# Altium project MotorDriver_Board-v1.0.PrjPcb (part 2 of 2)

## Sheet Controller Sheet.SchDoc
size A4; SheetNumber: 4; SheetTotal: 5
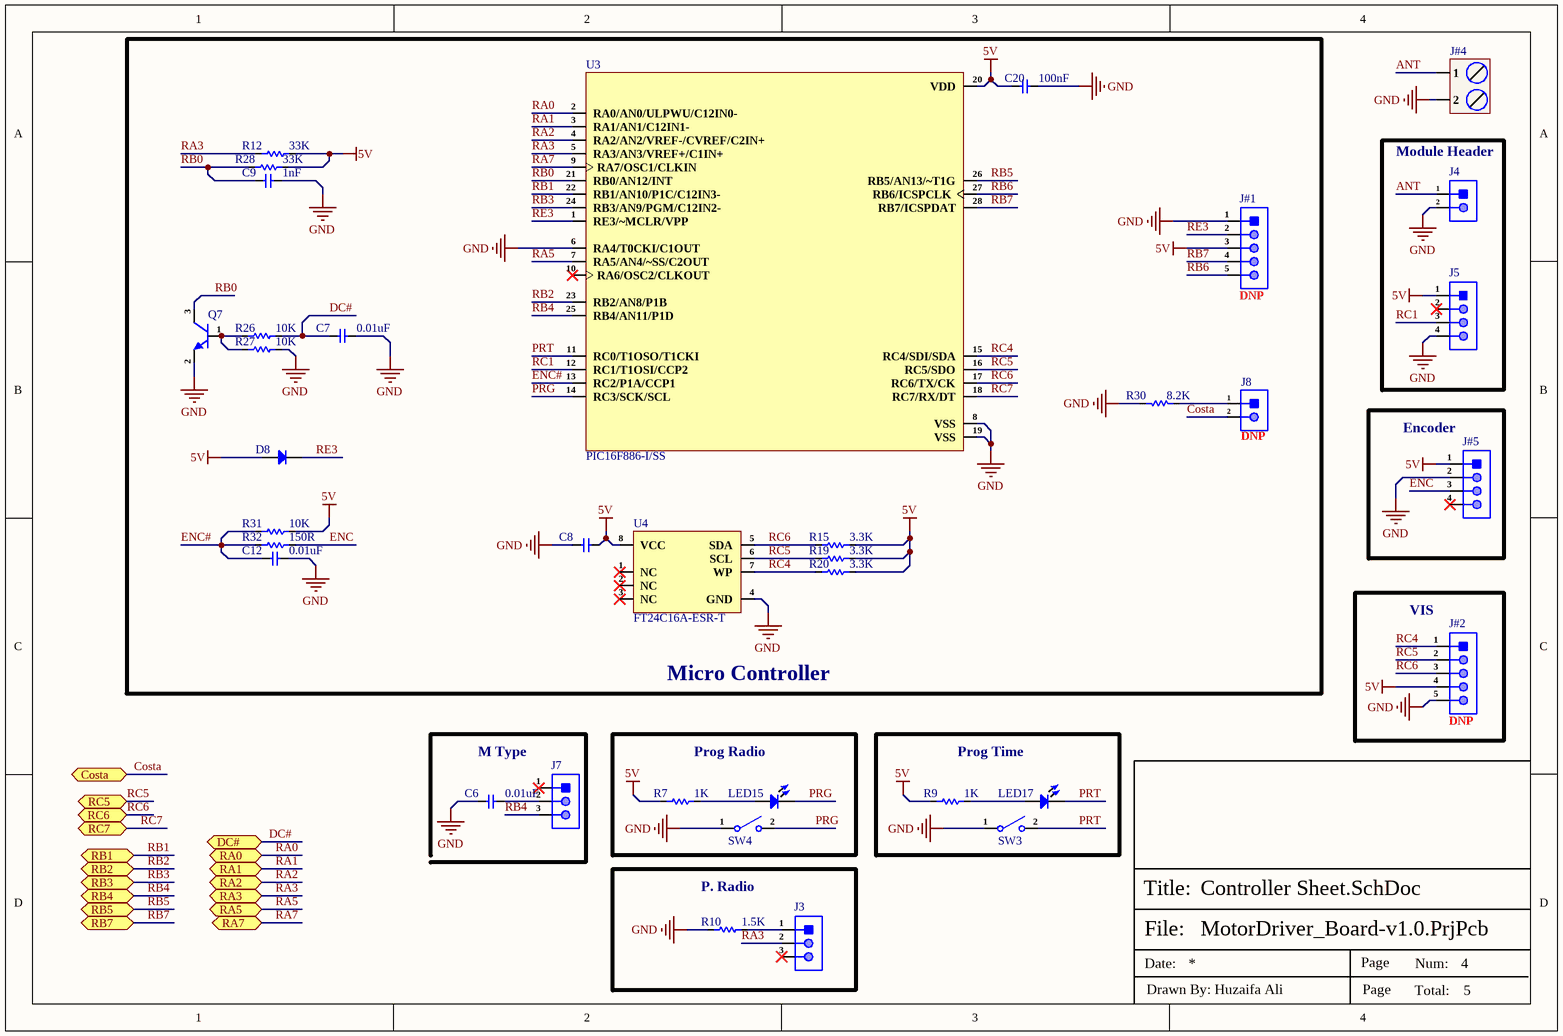
[diagram p2: Controller Sheet.SchDoc]

### Parts
C6  0.01uF  [Cap-0603]
C7  0.01uF  [Cap-0603]
C8  100nF  [Cap-0603]  (value not drawn)
C9  1nF  [Cap-0603]
C12  0.01uF  [Cap-0603]
C20  100nF  [Cap-0603]
D8  1N4148W-7-F  [SOD-123]  (value not drawn)
J3  (no value)  [HDR1X3_]
J4  DM254R-11-02-85  [HDR1X2 (Female)]  (value not drawn)
J5  PPTC041LFBN-RC  [HDR1X4 Female]  (value not drawn)
J7  B-2100S03P-A110  [HDR1X3_]  (value not drawn)
J8  DNP  [HDR1X2 (Female)]
J#1  DNP  [HDR 1x5 Female]
J#2  DNP  [HDR 1x5 Female]
J#4  DB128L-5.08-2P-BK-S  [DB128L-5.08-2P-BK-S]  (value not drawn)
J#5  M2510V-04P  [M2510V-04P]  (value not drawn)
LED15  Blue  [LED-0603]  (value not drawn)
LED17  Blue  [LED-0603]  (value not drawn)
Q7  BC817 6B 160-400  [SOT-23]  (value not drawn)
R7  1K  [Res-0603]
R9  1K  [Res-0603]
R10  1.5K  [Res-0603]
R12  33K  [Res-0603]
R15  3.3K  [Res-0603]
R19  3.3K  [Res-0603]
R20  3.3K  [Res-0603]
R26  10K  [Res-0603]
R27  10K  [Res-0603]
R28  33K  [Res-0603]
R30  8.2K  [Res-0603]
R31  10K  [Res-0603]
R32  150R  [Res-0603]
SW3  TS-1185EC-C-D-B  [TS-1185EC-C-D-B_]  (value not drawn)
SW4  TS-1185EC-C-D-B  [TS-1185EC-C-D-B_]  (value not drawn)
U3  PIC16F886-I/SS  [SSOP-28-208mil]
U4  FT24C16A-ESR-T  [SOP-8]

### Blocks framed on the sheet
Micro Controller: C7-C9 C12 C20 D8 J8 J#1 Q7 R12 R15 R19 R20 R26-R28 R30-R32 U3 U4
Module Header: J4 J5
Encoder: J#5
VIS: J#2
Prog Radio: LED15 R7 SW4
Prog Time: LED17 R9 SW3
P. Radio: J3 R10

### Ports
Costa (bidir, see Top Sheet[3B], Connector Sheet[1D], Peripheral Sheet[1D]), DC# (bidir, see Top Sheet[2B], Power Sheet[1D]), RA0 (bidir, see Top Sheet[3B], Peripheral Sheet[1D]), RA1 (bidir, see Top Sheet[3B], Peripheral Sheet[1D]), RA2 (bidir, see Top Sheet[3B], Peripheral Sheet[1D]), RA3 (bidir, see Top Sheet[3B], Peripheral Sheet[1D]), RA5 (bidir, see Top Sheet[3C], Peripheral Sheet[1D]), RA7 (bidir, see Top Sheet[3C], Peripheral Sheet[1D]), RB1 (bidir, see Top Sheet[2B], Power Sheet[1D]), RB2 (bidir, see Top Sheet[2B], Power Sheet[1D]), RB3 (bidir, see Top Sheet[2B], Power Sheet[1D]), RB4 (bidir, see Top Sheet[2B], Power Sheet[1D]), RB5 (bidir, see Top Sheet[2B], Power Sheet[1D]), RB7 (bidir, see Top Sheet[3C], Peripheral Sheet[1D]), RC5 (bidir, see Top Sheet[3C], Peripheral Sheet[1D]), RC6 (bidir, see Top Sheet[3C], Peripheral Sheet[1D]), RC7 (bidir, see Top Sheet[3C], Peripheral Sheet[1D])

### Nets
5V: C8.1 C20.2 D8.1(A) J5.1 J#1.3 J#2.4 J#5.1 R7.1 R9.1 R12.2 R15.2 R19.2 R20.2 R28.2 R31.1 U3.20(VDD) U4.8(VCC)
GND: C6.1 C7.2 C8.2 C9.2 C12.2 C20.1 J4.2 J5.4 J#1.1 J#2.5 J#4.2 J#5.2 Q7.2(E) R10.1 R27.2 R30.2 SW3.1 SW4.1 U3.6(RA4/T0CKI/C1OUT) U3.8(VSS) U3.19(VSS) U4.4(GND)
ANT: J4.1 J#4.1
Costa: J8.2 ; port Costa
DC#: C7.1 R26.2 ; port DC#
ENC: J#5.3 R32.2
ENC#: C12.1 R31.2 R32.1 U3.13(RC2/P1A/CCP1)
PRG: LED15.2 SW4.2 U3.14(RC3/SCK/SCL)
PRT: LED17.2 SW3.2 U3.11(RC0/T1OSO/T1CKI)
RA0: U3.2(RA0/AN0/ULPWU/C12IN0-) ; port RA0
RA1: U3.3(RA1/AN1/C12IN1-) ; port RA1
RA2: U3.4(RA2/AN2/VREF-/CVREF/C2IN+) ; port RA2
RA3: J3.2 R12.1 U3.5(RA3/AN3/VREF+/C1IN+) ; port RA3
RA5: U3.7(RA5/AN4/~SS/C2OUT) ; port RA5
RA7: U3.9(RA7/OSC1/CLKIN) ; port RA7
RB0: C9.1 Q7.3(C) R28.1 U3.21(RB0/AN12/INT)
RB1: U3.22(RB1/AN10/P1C/C12IN3-) ; port RB1
RB2: U3.23(RB2/AN8/P1B) ; port RB2
RB3: U3.24(RB3/AN9/PGM/C12IN2-) ; port RB3
RB4: J7.3 U3.25(RB4/AN11/P1D) ; port RB4
RB5: U3.26(RB5/AN13/~T1G) ; port RB5
RB6: J#1.5 U3.27(RB6/ICSPCLK)
RB7: J#1.4 U3.28(RB7/ICSPDAT) ; port RB7
RC1: J5.3 U3.12(RC1/T1OSI/CCP2)
RC4: J#2.1 R20.1 U3.15(RC4/SDI/SDA) U4.7(WP)
RC5: J#2.2 R19.1 U3.16(RC5/SDO) U4.6(SCL) ; port RC5
RC6: J#2.3 R15.1 U3.17(RC6/TX/CK) U4.5(SDA) ; port RC6
RC7: U3.18(RC7/RX/DT) ; port RC7
RE3: D8.2(K) J#1.2 U3.1(RE3/~MCLR/VPP)
NetC6_2: C6.2 J7.2
NetJ3_1: J3.1 R10.2
NetJ8_1: J8.1 R30.1
NetLED15_1: LED15.1 R7.2
NetLED17_1: LED17.1 R9.2
NetQ7_1: Q7.1(B) R26.1 R27.1

Not connected (* = marked no-connect by the designer): J3 3*; J5 2*; J7 1*; J#5 4*; U3 10(RA6/OSC2/CLKOUT)*; U4 1(NC)* 2(NC)* 3(NC)*

### Notes on the sheet
- M Type
- File:
- Title:
- Date:
- Page
- Num:
- Total:
- Drawn By: Huzaifa Ali

### Library data of the parts
C6 C7 C12 = GRM1885C1H103JA01D: CAP CER 10000PF 50V C0G/NP0 0603; Manufacturer: Murata; Material: Ceramic; Capacitance: 10nF; Tolerance: 5%; Dielectric: C0G; Supplier 1: RSComponents; Manufacturer Part Number: GRM1885C1H103JA01D; RoHS: Yes; Category: Ceramic Capacitors; Stock 1: 80000; Pricing 1: 4000=0.03500, 8000=0.03200 (GBP); Mount: Surface Mount; Case/Package: 0603; Case Code (Metric): 1608; Case Code (Imperial): 0603; Min Operating Temperature: -55°C; Max Operating Temperature: 125°C; Packaging: Tape and Reel; Package Quantity: 4000; Voltage Rating: 50V; Voltage Rating (DC): 50V; Termination: SMD/SMT; Voltage: 50V; Series: GRM; Length: 1.6mm; Width: 0.8mm; Height: 0.8mm; Thickness: 0.035inch; Lead Pitch: 0.5mm; Depth: 0.8mm; REACH SVHC: No SVHC; Lead Free: Lead Free; RoHS Compliant: Yes; ComponentLink1URL: https://datasheet.ciiva.com/41860/partnumbering-e-01-41860759.pdf?src-supplier=Digi-Key; ComponentLink1Description: https://datasheet.ciiva.com/41860/partnumbering-e-01-41860759.pdf?src-supplier=Digi-Key; ComponentLink2URL: https://datasheet.ciiva.com/29537/partnumbering-e-01-29537910.pdf?src-supplier=Digi-Key; ComponentLink2Description: https://datasheet.ciiva.com/29537/partnumbering-e-01-29537910.pdf?src-supplier=Digi-Key; Supplier Part Number 1: 1449032
C8 C20 = CC0603KRX5R9BB104: CAP CER 0.1UF 50V X5R 0603; Manufacturer: Yageo; Tolerance: 10%; Item Type: Capacitor; Supplier 1: Digi-Key; Manufacturer Part Number: CC0603KRX5R9BB104; RoHS: Yes; Category: Ceramic Capacitors; Stock 1: 152253; Pricing 1: 1=0.10000, 10=0.05200, 50=0.02820, 100=0.02310, 500=0.01648, 1000=0.01294 (USD); Mount: Surface Mount; Case/Package: 0603; Case Code (Imperial): 0603; Case Code (Metric): 1608; Weight: 7.1E-05oz; Min Operating Temperature: -55°C; Max Operating Temperature: 85°C; Capacitance: 100nF; Packaging: Tape and Reel; Voltage Rating: 50V; Dielectric: X5R; Termination: SMD/SMT; Voltage Rating (DC): 50V; Package Quantity: 4000; Length: 0.063inch; Width: 0.031inch; Thickness: 0.035inch; Lead Free: Lead Free; Halogen Free: Halogen Free; ComponentLink1URL: http://www.mouser.com/ds/2/447/Yageo_UPY-GP_NP0_16V-to-50V_9-358835.pdf?src-supplier=Mouser; ComponentLink1Description: http://www.mouser.com/ds/2/447/Yageo_UPY-GP_NP0_16V-to-50V_9-358835.pdf?src-supplier=Mouser; ComponentLink2URL: https://www.yageo.com/upload/media/product/productsearch/datasheet/mlcc/UPY-GPHC_X5R_4V-to-50V_26.pdf?src-supplier=Digi-Key; ComponentLink2Description: https://www.yageo.com/upload/media/product/productsearch/datasheet/mlcc/UPY-GPHC_X5R_4V-to-50V_26.pdf?src-supplier=Digi-Key; ComponentLink3URL: http://www.yageo.com/exep/pages/download/literatures/ProductSelectionGuide%202014_Final_2.pdf?src-supplier=Digi-Key; ComponentLink3Description: http://www.yageo.com/exep/pages/download/literatures/ProductSelectionGuide%202014_Final_2.pdf?src-supplier=Digi-Key; Supplier Part Number 1: 311-4046-1-ND; LCSC Part Number: C110022
C9 = CC0603KRX7R8BB102: CAP CER 0603 1nF 25 V ±10 % Tolerance X7R SMT; Manufacturer: Yageo; Tolerance: 10%; Voltage Rating: 25V; Supplier 1: Arrow Electronics; Manufacturer Part Number: CC0603KRX7R8BB102; RoHS: Yes; Category: Ceramic Capacitors; Stock 1: 974; Pricing 1: 1=0.07500, 10=0.04120, 25=0.04030, 100=0.02020, 250=0.02000, 500=0.01320 (USD); Mount: Surface Mount; Case/Package: 0603; Case Code (Imperial): 0603; Case Code (Metric): 1608; Weight: 7.1E-05oz; Min Operating Temperature: -55°C; Max Operating Temperature: 125°C; Capacitance: 1nF; Dielectric: X7R; Packaging: Tape and Reel; Voltage Rating (DC): 25V; Termination: SMD/SMT; Resistor Type: Ceramic; Series: CC; Construction: Flat; Length: 1.6mm; Width: 0.031inch; Height: 0.8mm; Thickness: 0.035inch; Depth: 0.8mm; Radiation Hardening: No; Lead Free: Lead Free; Halogen Free: Halogen Free; RoHS Compliant: Yes; ComponentLink1URL: https://datasheet.ciiva.com/13263/upy-gphc-x7r-6-3v-to-50v-8-12304-13263372.pdf?src-supplier=Mouser; ComponentLink1Description: https://datasheet.ciiva.com/13263/upy-gphc-x7r-6-3v-to-50v-8-12304-13263372.pdf?src-supplier=Mouser; Supplier Part Number 1: CC0603KRX7R8BB102; LCSC Part Number: C519404
D8 = 1N4148W-7-F: DIODE GEN PURP 100V 300MA SOD123; Manufacturer: Diodes; Forward Current: 150mA; Reverse Recovery Time: 4ns; Max Forward Surge Current (Ifsm): 2A; Element Configuration: Single; Max Reverse Current: 1uA; Forward Voltage: 1.25V; Power Dissipation: 400mW; Polarity: Standard; Voltage Rating (DC): 75V; Value: 2pF; Supplier 1: Future Electronics; Manufacturer Part Number: 1N4148W-7-F; RoHS: Yes; Category: Rectifier Diodes; Stock 1: 32931000; Pricing 1: 3000=0.01840, 12000=0.01760, 45000=0.01690, 120000=0.01640, 300000=0.01560 (USD); Mounting Technology: Surface Mount; Pins: 2; Weight: 0.000353oz; Contact Plating: Tin,Matte; Min Operating Temperature: -65°C; Max Operating Temperature: 150°C; Packaging: Tape and Reel; Max Repetitive Reverse Voltage (Vrrm): 100V; Peak Non-Repetitive Surge Current: 2A; Voltage: 100V; Max Surge Current: 2A; Package Quantity: 3000; Recovery Time: 4ns; Average Rectified Current: 300mA; Power Rating: 400mW; Current Rating: 150mA; Output Current: 150mA; Max Reverse Voltage (DC): 100V; Series: -; Reverse Recovery Time-Max: 4ns; Length: 2.85mm; Width: 1.7mm; Height: 1.25mm; Radiation Hardening: No; RoHS Compliant: Yes; Reach SVHC Compliant: Yes; Lead Free: Lead Free; ComponentLink1URL: https://datasheet.ciiva.com/1179/1915529-1179304.pdf?src-supplier=Element14; ComponentLink1Description: https://datasheet.ciiva.com/1179/1915529-1179304.pdf?src-supplier=Element14; ComponentLink2URL: https://datasheet.ciiva.com/22695/1915529-22695239.pdf?src-supplier=Element14; ComponentLink2Description: https://datasheet.ciiva.com/22695/1915529-22695239.pdf?src-supplier=Element14; ComponentLink3URL: https://datasheet.ciiva.com/8300/ds30086-8300392.pdf?src-supplier=Avnet; ComponentLink3Description: https://datasheet.ciiva.com/8300/ds30086-8300392.pdf?src-supplier=Avnet; ComponentLink4URL: https://datasheet.ciiva.com/15219/getdatasheetpartid-110030-15219548.pdf?src-supplier=Verical; ComponentLink4Description: https://datasheet.ciiva.com/15219/getdatasheetpartid-110030-15219548.pdf?src-supplier=Verical; ComponentLink5URL: https://datasheet.ciiva.com/8303/ds30086-8303197.pdf?src-supplier=Avnet; ComponentLink5Description: https://datasheet.ciiva.com/8303/ds30086-8303197.pdf?src-supplier=Avnet; ComponentLink6URL: https://datasheet.ciiva.com/911/ds30086-911735.pdf?src-supplier=Digi-Key; ComponentLink6Description: https://datasheet.ciiva.com/911/ds30086-911735.pdf?src-supplier=Digi-Key; ComponentLink7URL: https://datasheet.ciiva.com/911/ds30086-911736.pdf?src-supplier=Digi-Key; ComponentLink7Description: https://datasheet.ciiva.com/911/ds30086-911736.pdf?src-supplier=Digi-Key; ComponentLink8URL: https://datasheet.ciiva.com/911/ds30086-911734.pdf?src-supplier=Digi-Key; ComponentLink8Description: https://datasheet.ciiva.com/911/ds30086-911734.pdf?src-supplier=Digi-Key; ComponentLink9URL: https://datasheet.ciiva.com/4435/ds30086-4435128.pdf?src-supplier=Mouser; ComponentLink9Description: https://datasheet.ciiva.com/4435/ds30086-4435128.pdf?src-supplier=Mouser; Supplier Part Number 1: 7634694; LCSC Part Number: C83528; Item Type: Diode
J3 J7 = B-2100S03P-A110: Straight 2.54mm Black Brass 1x3P Plugin,P=2.54mm Pin Headers ROHS; Manufacturer: Ckmtw; Item Type: Header; LCSC Part Number: C124376; Manufacturer Part Number: B-2100S03P-A110; ComponentLink1Description: LCSC; ComponentLink1URL: https://www.lcsc.com/product-detail/Pin-Headers_Ckmtw-Shenzhen-Cankemeng-B-2100S03P-A110_C124376.html
J4 J8 = DM254R-11-02-85: 2.54mm Plugin 3A 2P Straight 1x2P 8.5mm Top Square Holes Plugin,P=2.54mm Female Headers ROHS; Manufacturer: DEALON; Item Type: Header; Manufacturer Part Number: DM254R-11-02-85; Package: Plugin,P=2.54mm; LCSC Part Number: C2935973; ComponentLink1Description: LCSC; ComponentLink1URL: https://www.lcsc.com/product-detail/span-style-background-color-ff0-Female-span-Headers_DEALON-DM254R-11-02-85_C2935973.html
J5 = PPTC041LFBN-RC: CONN HEADER FEMALE 4POS .1 TIN; Manufacturer: Sullins; Number of Positions: 4; Voltage Rating: 250V; Pitch: 2.54mm; Supplier 1: Future Electronics; Manufacturer Part Number: PPTC041LFBN-RC; RoHS: Yes; Category: Connectors; Stock 1: 915; Pricing 1: 1=0.28500, 150=0.27500, 400=0.26500, 1500=0.25500, 4000=0.23500 (USD); Mounting Technology: Through Hole; Contact Material: Bronze; Housing Material: Plastic; Contact Finish - Mating: TIN; Insulation Color: Black; Insulation Material: Polyester; Contact Shape: Square; Min Operating Temperature: -40°C; Max Operating Temperature: 105°C; Number of Rows: 1; Packaging: Tray; Termination: Solder; Connector Type: Header; Contact Type: Female Socket; Fastening Type: Pull; Series: -; Length: 10.7mm; Width: 2.5mm; Height: 8.5mm; Lead Free: Lead Free; RoHS Compliant: Yes; Flammability Rating: UL94 V-0; ComponentLink1URL: https://media.digikey.com/pdf/Data%20Sheets/Sullins%20PDFs/Female_Headers.100_DS.pdf?src-supplier=Digi-Key; ComponentLink1Description: https://media.digikey.com/pdf/Data%20Sheets/Sullins%20PDFs/Female_Headers.100_DS.pdf?src-supplier=Digi-Key; ComponentLink2URL: http://www.sullinscorp.com/catalogs/78_Page80-81_HEADER_.100_2.54mm_FEMALE.pdf?src-supplier=Future+Electronics; ComponentLink2Description: http://www.sullinscorp.com/catalogs/78_Page80-81_HEADER_.100_2.54mm_FEMALE.pdf?src-supplier=Future+Electronics; Supplier Part Number 1: 7137813; LCSC Part Number: C3319639; Item Type: Header
J#1 J#2 = C50950: 2.54mm Plugin Straight 1x5P 5 Plugin,P=2.54mm Female Headers ROHS; Manufacturer: BOOMELE; Manufacturer Part Number: C50950; Package: Plugin,P=2.54mm; LCSC Part Number: C50950; Item Type: Female Header; ComponentLink1Description: LCSC; ComponentLink1URL: https://www.lcsc.com/product-detail/Female-Headers_BOOMELE-Boom-Precision-Elec-C50950_C50950.html
J#4 = DB128L-5.08-2P-BK-S: 1x2P 18A -40℃~+105℃ 250V Black 12~30 Straight pin 5.08mm 2.5 1 2 Plugin,P=5.08mm Screw terminal ROHS; Manufacturer: DIBO; Item Type: Terminal Block; Manufacturer Part Number: DB128L-5.08-2P-BK-S; Package: Plugin,P=5.08mm; LCSC Part Number: C430601; ComponentLink1Description: LCSC; ComponentLink1URL: https://www.lcsc.com/product-detail/Screw-terminal_span-style-background-color-ff0-DIBO-span-DB128L-5-08-2P-BK-S_C430601.html
J#5 = M2510V-04P: 1x4P 1 2.54mm Male pin 4 -25℃~+85℃ 3A Straight Plugin,P=2.54mm Wire To Board / Wire To Wire Connector ROHS; Manufacturer: XFCN; Item Type: Wire To Board Connector; Manufacturer Part Number: M2510V-04P; Package: Plugin,P=2.54mm; LCSC Part Number: C2764792; ComponentLink1Description: LCSC; ComponentLink1URL: https://www.lcsc.com/product-detail/Wire-To-Board-Wire-To-Wire-Connector_XFCN-M2510V-04P_C2764792.html
LED15 LED17 = NCD0603B3: blue 0603 Light Emitting Diodes (LED) ROHS; Manufacturer: Foshan NationStar Optoelectronics; Manufacturer Part Number: NCD0603B3; Package: 0603; LCSC Part Number: C158101; Item Type: LED; ComponentLink1Description: LCSC; ComponentLink1URL: https://www.lcsc.com/product-detail/Light-Emitting-Diodes-LED_Foshan-NationStar-Optoelectronics-NCD0603B3_C158101.html
Q7 = BC817 6B 160-400: 45V 300mW 100@100mA,1V 500mA NPN SOT-23 Bipolar Transistors - BJT ROHS; Manufacturer: DOWO; Manufacturer Part Number: BC817 6B 160-400; Package: SOT-23; LCSC Part Number: C371086; Item Type: Transistor; ComponentLink1Description: LCSC; ComponentLink1URL: https://www.lcsc.com/product-detail/Bipolar-Transistors-BJT_DOWO-BC817-6B-160-400_C371086.html
R7 R9 = RT0603DRD071KL: RES SMD 1K OHM 0.5% 1/10W 0603; Manufacturer: Yageo; Resistance: 1kR; Temperature Coefficient: 25ppm/°C; Power Rating: 100mW; Voltage Rating: 75V; Voltage Rating (DC): 50V; Supplier 1: Digi-Key; Manufacturer Part Number: RT0603DRD071KL; Stock 1: 178947; Pricing 1: 1=0.2, 10=0.167, 100=0.0651, 1000=0.02725, 2500=0.02498 (USD); Case/Package: 0603; Contact Plating: Tin,Matte; Case Code (Metric): 1608; Case Code (Imperial): 0603; Min Operating Temperature: -55°C; Max Operating Temperature: 125°C; Tolerance: 0.5%; Composition: Thin Film; Packaging: Tape and Reel; Termination: SMD/SMT; Radiation Hardening: No; Lead Free: Lead Free; ComponentLink1URL: http://www.mouser.com/ds/2/447/yageodocoutput-1125656.pdf?src-supplier=Mouser; ComponentLink1Description: http://www.mouser.com/ds/2/447/yageodocoutput-1125656.pdf?src-supplier=Mouser; ComponentLink2URL: http://www.yageo.com/documents/recent/PYu-RT_1-to-0.05_RoHS_L_6.pdf?src-supplier=Avnet; ComponentLink2Description: http://www.yageo.com/documents/recent/PYu-RT_1-to-0.05_RoHS_L_6.pdf?src-supplier=Avnet; Supplier Part Number 1: 311-1.0KDDKR-ND; LCSC Part Number: C165964
R10 = RC0603FR-071K5L: RES 1.5K OHM 1% 1/10W 0603; Manufacturer: Yageo; Voltage Rating (DC): 50V; Resistance: 1.5kR; Temperature Coefficient: 100ppm/°C; Power Rating: 100mW; Item Type: Resistor; Supplier 1: Arrow Electronics; Manufacturer Part Number: RC0603FR-071K5L; RoHS: Yes; Category: Chip SMD Resistors; Stock 1: 15000; Pricing 1: 1=0.00160, 5000=0.00160 (USD); Case/Package: 0603; Number of Pins: 2; Case Code (Metric): 1608; Case Code (Imperial): 0603; Size Code: 0603; Min Operating Temperature: -55°C; Max Operating Temperature: 155°C; Tolerance: 1%; Packaging: Tape and Reel; Resistor Type: Thick Film; Voltage Rating: 50V; Package Quantity: 1; Number of Terminations: 2; Termination: SMD/SMT; Max Power Dissipation: 100mW; Features: Moisture Resistant; Series: RC; Resistance Tolerance: 1%; Construction: Rectangular; Length: 0.063inch; Width: 0.031inch; Height: 0.022inch; Depth: 0.8mm; REACH SVHC: No SVHC; Lead Free: Lead Free; Military Standard: Not; RoHS Compliant: Yes; Supplier Part Number 1: RC0603FR-071K5L; LCSC Part Number: C114668
R12 R28 = RT0603BRD0733KL: RES SMD 33K OHM 0.1% 1/10W 0603; Manufacturer: Yageo; Resistance: 33kR; Power Rating: 100mW; Voltage Rating: 75V; Temperature Coefficient: 25ppm/°C; Voltage Rating (DC): 50V; Supplier 1: Arrow Electronics; Manufacturer Part Number: RT0603BRD0733KL; RoHS: Yes; Category: Chip SMD Resistors; Stock 1: 2; Pricing 1: 1=0.30860 (USD); Case/Package: 0603; Case Code (Metric): 1608; Case Code (Imperial): 0603; Weight: 7.1E-05oz; Contact Plating: Tin,Matte; Size Code: 0603; Min Operating Temperature: -55°C; Max Operating Temperature: 125°C; Package Quantity: 5000; Packaging: Tape and Reel; Resistor Type: Thin Film; Number of Terminations: 2; Termination: SMD/SMT; Max Power Dissipation: 100mW; Features: Moisture Resistant; Series: RT; Construction: Rectangular; Length: 1.6mm; Width: 0.031inch; Height: 0.022inch; Depth: 0.8mm; Radiation Hardening: No; Military Standard: Not; Lead Free: Lead Free; RoHS Compliant: Yes; ComponentLink1URL: https://datasheet.ciiva.com/2585/pyu-rt-1-to-0-05-rohs-l-4-2585891.pdf?src-supplier=Digi-Key; ComponentLink1Description: https://datasheet.ciiva.com/2585/pyu-rt-1-to-0-05-rohs-l-4-2585891.pdf?src-supplier=Digi-Key; ComponentLink2URL: https://datasheet.ciiva.com/12810/pyu-rt-1-to-0-05-rohs-l-4-12810117.pdf?src-supplier=Mouser; ComponentLink2Description: https://datasheet.ciiva.com/12810/pyu-rt-1-to-0-05-rohs-l-4-12810117.pdf?src-supplier=Mouser; ComponentLink3URL: https://datasheet.ciiva.com/8889/pyu-rt-1-to-0-05-rohs-l-4-8889590.pdf?src-supplier=Avnet; ComponentLink3Description: https://datasheet.ciiva.com/8889/pyu-rt-1-to-0-05-rohs-l-4-8889590.pdf?src-supplier=Avnet; Supplier Part Number 1: RT0603BRD0733KL; LCSC Part Number: C705768
R15 R19 R20 = RC0603FR-073K3L: RES SMD 3.3K OHM 1% 1/10W 0603; Manufacturer: Yageo Phycomp; Temperature Coefficient: 100ppm/°C; Resistance: 3.3kR; Voltage Rating (DC): 50V; Power Rating: 100mW; Item Type: Resistor; Supplier 1: Digi-Key; Manufacturer Part Number: RC0603FR-073K3L; Stock 1: 6863000; Pricing 1: 1=0.1, 10=0.024, 100=0.0097, 1000=0.00437, 2500=0.00379 (USD); Mount: Surface Mount; Case/Package: 0603; Number of Pins: 2; Min Operating Temperature: -55°C; Max Operating Temperature: 155°C; Tolerance: 1%; Packaging: Cut Tape; Length: 1.6mm; Height: 0.45mm; Width: 800um; Depth: 0.8mm; REACH SVHC: No SVHC; Lead Free: Lead Free; Supplier Part Number 1: 311-3.30KHRCT-ND; LCSC Part Number: C108078
R26 R27 R31 = RC0603FR-0710KL: RES SMD 10K Ohm 1% 1/10W 0603; Manufacturer: Yageo; Resistance: 10kR; Temperature Coefficient: 100ppm/°C; Voltage Rating (DC): 50V; Power Rating: 100mW; Voltage Rating: 75V; Item Type: Resistor; Supplier 1: Digi-Key; Manufacturer Part Number: RC0603FR-0710KL; RoHS: Yes; Category: Chip SMD Resistors; Stock 1: 25249139; Pricing 1: 1=0.10000, 10=0.02400, 100=0.00970, 1000=0.00436, 2500=0.00378 (USD); Case/Package: 0603; Number of Pins: 2; Case Code (Imperial): 0603; Case Code (Metric): 1608; Weight: 7.1E-05oz; Size Code: 0603; Min Operating Temperature: -55°C; Max Operating Temperature: 155°C; Tolerance: 1%; Resistor Type: Thick Film; Packaging: Tape and Reel; Termination: SMD/SMT; Features: Moisture Resistant; Series: RC; Max Power Dissipation: 100mW; Number of Terminations: 2; Resistance Tolerance: 1%; Construction: Rectangular; Length: 1.6mm; Width: 0.8mm; Height: 0.45mm; Depth: 0.8mm; Lead Pitch: 0.3mm; REACH SVHC: Unknown; Lead Free: Lead Free; Military Standard: Not; RoHS Compliant: Yes; ComponentLink1URL: https://datasheet.ciiva.com/7660/38590-7660789.pdf?src-supplier=Element14; ComponentLink1Description: https://datasheet.ciiva.com/7660/38590-7660789.pdf?src-supplier=Element14; ComponentLink2URL: https://datasheet.ciiva.com/7983/443971-7983596.pdf?src-supplier=Element14; ComponentLink2Description: https://datasheet.ciiva.com/7983/443971-7983596.pdf?src-supplier=Element14; ComponentLink3URL: https://datasheet.ciiva.com/22747/443971-22747519.pdf?src-supplier=Element14; ComponentLink3Description: https://datasheet.ciiva.com/22747/443971-22747519.pdf?src-supplier=Element14; ComponentLink4URL: https://datasheet.ciiva.com/46440/1868787-46440891.pdf?src-supplier=Element14; ComponentLink4Description: https://datasheet.ciiva.com/46440/1868787-46440891.pdf?src-supplier=Element14; ComponentLink5URL: https://datasheet.ciiva.com/7746/1738695-7746239.pdf?src-supplier=Element14; ComponentLink5Description: https://datasheet.ciiva.com/7746/1738695-7746239.pdf?src-supplier=Element14; ComponentLink6URL: https://datasheet.ciiva.com/15189/getdatasheetpartid-409289-15189591.pdf?src-supplier=Verical; ComponentLink6Description: https://datasheet.ciiva.com/15189/getdatasheetpartid-409289-15189591.pdf?src-supplier=Verical; Supplier Part Number 1: 311-10.0KHRCT-ND; LCSC Part Number: C98220
R30 = RT0603BRD078K2L: RES SMD 8.2K OHM 0.1% 1/10W 0603; Manufacturer: Yageo; Power: 100mW; Rated Temperature: 70°C; Value: 8.2kR; Temperature Coefficient: 25ppm/°C; Working Voltage: 75V; Package Height: 0.45mm; Package Length: 1.6mm; Package Width: 0.8mm; Item Type: Resistor; Supplier 1: Rs; Manufacturer Part Number: RT0603BRD078K2L; RoHS: Yes; Category: Chip SMD Resistors; Stock 1: 4900; Pricing 1: 100=0.21900, 250=0.20400, 500=0.19000, 1000=0.17400 (GBP); Mounting Technology: Surface Mount; Pins: 2; Case/Package: 0603; Min Operating Temperature: -55°C; Max Operating Temperature: 155°C; Tolerance: 0.1%; Resistor Type: FIXED RESISTOR; Construction: Chip; Package Style: SMTMeter; Packaging: Tape and Reel; Technology: THIN FILM; Termination: Wraparound; Reach SVHC Compliant: Yes; RoHS Compliant: Yes; ComponentLink1URL: https://datasheet.ciiva.com:443/pdfs/VipMasterIC/IC/YAGO/YAGO-S-A0008510989/YAGO-S-A0008510989-1.pdf?src-supplier=IHS+Markit; ComponentLink1Description: https://datasheet.ciiva.com:443/pdfs/VipMasterIC/IC/YAGO/YAGO-S-A0008510989/YAGO-S-A0008510989-1.pdf?src-supplier=IHS+Markit; ComponentLink2URL: https://datasheet.ciiva.com/12809/pyu-rt-1-to-0-05-rohs-l-4-12809820.pdf?src-supplier=Mouser; ComponentLink2Description: https://datasheet.ciiva.com/12809/pyu-rt-1-to-0-05-rohs-l-4-12809820.pdf?src-supplier=Mouser; Supplier Part Number 1: 1991627P; LCSC Part Number: C861589
R32 = RC0603FR-07150RL: RES SMD 150OHM 1/10W 0603; Manufacturer: Yageo; Tolerance: 1%; Power Rating: 100mW; Voltage Rating (DC): 50V; Temperature Coefficient: 100ppm/°C; Supplier 1: Digi-Key; Manufacturer Part Number: RC0603FR-07150RL; RoHS: Yes; Category: Chip SMD Resistors; Stock 1: 263721; Pricing 1: 1=0.10000, 10=0.02400, 100=0.00970, 1000=0.00436, 2500=0.00378 (USD); Case/Package: 0603; Number of Pins: 2; Case Code (Imperial): 0603; Case Code (Metric): 1608; Size Code: 0603; Min Operating Temperature: -55°C; Max Operating Temperature: 155°C; Resistance: 150R; Packaging: Tape and Reel; Voltage Rating: 50V; Package Quantity: 5000; Termination: SMD/SMT; Resistor Type: Thick Film; Features: Moisture Resistant; Series: RC; Max Power Dissipation: 100mW; Number of Terminations: 2; Resistance Tolerance: 1%; Construction: Rectangular; Length: 1.6mm; Width: 0.8mm; Height: 0.45mm; Depth: 0.8mm; REACH SVHC: No SVHC; Lead Free: Lead Free; Military Standard: Not; RoHS Compliant: Yes; ComponentLink1URL: https://datasheet.ciiva.com/46412/443971-46412844.pdf?src-supplier=Element14; ComponentLink1Description: https://datasheet.ciiva.com/46412/443971-46412844.pdf?src-supplier=Element14; ComponentLink2URL: https://datasheet.ciiva.com/46440/1868787-46440893.pdf?src-supplier=Element14; ComponentLink2Description: https://datasheet.ciiva.com/46440/1868787-46440893.pdf?src-supplier=Element14; ComponentLink3URL: https://datasheet.ciiva.com/12555/rc0603-272842-12555301.pdf?src-supplier=Mouser; ComponentLink3Description: https://datasheet.ciiva.com/12555/rc0603-272842-12555301.pdf?src-supplier=Mouser; Supplier Part Number 1: 311-150HRCT-ND; LCSC Part Number: C114608
SW3 SW4 = TS-1185EC-C-D-B: 3mm 2mm Round Button 50mA Top3.65mm SPST 12V SMD Tactile Switches; Manufacturer: XKB; Manufacturer Part Number: TS-1185EC-C-D-B; Footprint: Custom; ComponentLink1Description: LCSC; ComponentLink1URL: https://lcsc.com/product-detail/Tactile-Switches_XKB-Connectivity-TS-1185EC-C-D-B_C318893.html; LCSC Part Number: C318893
U3 = PIC16F886-I/SS: PIC PIC® 16F Microcontroller IC 8-Bit 20MHz 14KB (8K x 14) FLASH 28-SSOP; Manufacturer: Microchip; Supplier: Rs; Supplier Part Number: 400390P; Manufacturer Part Number: PIC16F886-I/SS; RoHS: Yes; Category: Microcontrollers; Stock: 1762; Pricing: 10=2.52, 25=2.454, 100=2.394 (GBP); ComponentLink1URL: https://datasheet.ciiva.com/29119/160448-da-01-en-pic-pic16f886-i-ss-29119398.pdf?src-supplier=Conrad; ComponentLink1Description: https://datasheet.ciiva.com/29119/160448-da-01-en-pic-pic16f886-i-ss-29119398.pdf?src-supplier=Conrad; ComponentLink2URL: https://datasheet.ciiva.com/3203/41291f-3203502.pdf?src-supplier=Avnet; ComponentLink2Description: https://datasheet.ciiva.com/3203/41291f-3203502.pdf?src-supplier=Avnet; LCSC Part Number: C38185; Item Type: IC
U4 = FT24C16A-ESR-T: IC EEPROM 16KBIT I2C 1MHZ 8SOP; Manufacturer: Fremont Micro Devices; Supplier: Digi-Key; Supplier Part Number: 1219-1246-2-ND; Manufacturer Part Number: FT24C16A-ESR-T; RoHS: No; Category: Memory; Pricing: 2500=0.16918 (USD); LCSC Part Number: C232877; Item Type: IC

## Sheet Peripheral Sheet.SchDoc
size A4; SheetNumber: 3; SheetTotal: 5
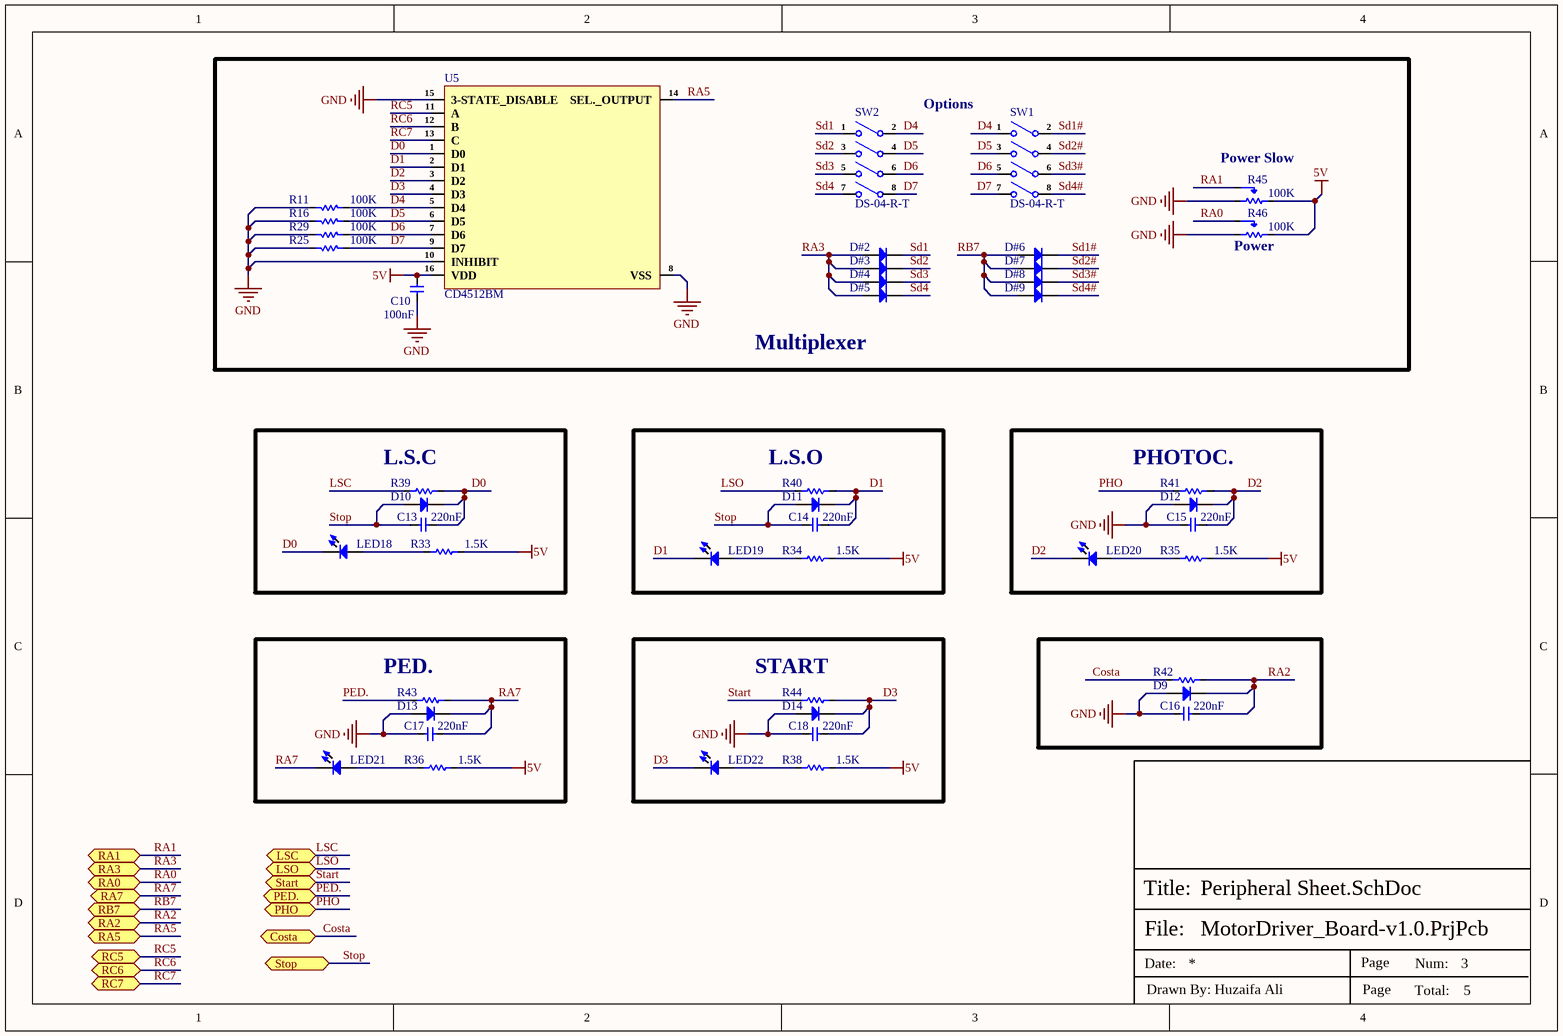
[diagram p3: Peripheral Sheet.SchDoc]

### Parts
C10  100nF  [Cap-0603]
C13  220nF  [Cap-0805]
C14  220nF  [Cap-0805]
C15  220nF  [Cap-0805]
C16  220nF  [Cap-0805]
C17  220nF  [Cap-0805]
C18  220nF  [Cap-0805]
D9  1N4148W-7-F  [SOD-123]  (value not drawn)
D10  1N4148W-7-F  [SOD-123]  (value not drawn)
D11  1N4148W-7-F  [SOD-123]  (value not drawn)
D12  1N4148W-7-F  [SOD-123]  (value not drawn)
D13  1N4148W-7-F  [SOD-123]  (value not drawn)
D14  1N4148W-7-F  [SOD-123]  (value not drawn)
D#2  1N4148W-7-F  [SOD-123]  (value not drawn)
D#3  1N4148W-7-F  [SOD-123]  (value not drawn)
D#4  1N4148W-7-F  [SOD-123]  (value not drawn)
D#5  1N4148W-7-F  [SOD-123]  (value not drawn)
D#6  1N4148W-7-F  [SOD-123]  (value not drawn)
D#7  1N4148W-7-F  [SOD-123]  (value not drawn)
D#8  1N4148W-7-F  [SOD-123]  (value not drawn)
D#9  1N4148W-7-F  [SOD-123]  (value not drawn)
LED18  Blue  [LED-0603]  (value not drawn)
LED19  Blue  [LED-0603]  (value not drawn)
LED20  Blue  [LED-0603]  (value not drawn)
LED21  Blue  [LED-0603]  (value not drawn)
LED22  Blue  [LED-0603]  (value not drawn)
R11  100K  [Res-0603]
R16  100K  [Res-0603]
R25  100K  [Res-0603]
R29  100K  [Res-0603]
R33  1.5K  [Res-0603]
R34  1.5K  [Res-0603]
R35  1.5K  [Res-0603]
R36  1.5K  [Res-0603]
R38  1.5K  [Res-0603]
R39  100R  [Res-0603]  (value not drawn)
R40  100R  [Res-0603]  (value not drawn)
R41  100R  [Res-0603]  (value not drawn)
R42  100R  [Res-0603]  (value not drawn)
R43  100R  [Res-0603]  (value not drawn)
R44  100R  [Res-0603]  (value not drawn)
R45  100K  [PT15-L-V-104(100K)]
R46  100K  [PT15-L-V-104(100K)]
SW1  DS-04-R-T  [DS-04-R-T]
SW2  DS-04-R-T  [DS-04-R-T]
U5  CD4512BM  [SOIC-16]

### Blocks framed on the sheet
Multiplexer: C10 D#2-D#9 R11 R16 R25 R29 R45 R46 SW1 SW2 U5
L.S.C: C13 D10 LED18 R33 R39
L.S.O: C14 D11 LED19 R34 R40
PHOTOC.: C15 D12 LED20 R35 R41
PED.: C17 D13 LED21 R36 R43
START: C18 D14 LED22 R38 R44

### Ports
Costa (bidir, see Top Sheet[3B], Connector Sheet[1D], Controller Sheet[1D]), LSC (bidir, see Top Sheet[3B], Connector Sheet[1C]), LSO (bidir, see Top Sheet[3B], Connector Sheet[1C]), PED. (bidir, see Top Sheet[3B], Connector Sheet[1C]), PHO (bidir, see Top Sheet[3B], Connector Sheet[1C]), RA0 (bidir, see Top Sheet[3B], Controller Sheet[1D]), RA1 (bidir, see Top Sheet[3B], Controller Sheet[1D]), RA2 (bidir, see Top Sheet[3B], Controller Sheet[1D]), RA3 (bidir, see Top Sheet[3B], Controller Sheet[1D]), RA5 (bidir, see Top Sheet[3C], Controller Sheet[1D]), RA7 (bidir, see Top Sheet[3C], Controller Sheet[1D]), RB7 (bidir, see Top Sheet[3C], Controller Sheet[1D]), RC5 (bidir, see Top Sheet[3C], Controller Sheet[1D]), RC6 (bidir, see Top Sheet[3C], Controller Sheet[1D]), RC7 (bidir, see Top Sheet[3C], Controller Sheet[1D]), Start (bidir, see Top Sheet[3A], Connector Sheet[1C]), Stop (bidir, see Top Sheet[3B], Connector Sheet[1D])

### Nets
5V: C10.2 R33.1 R34.1 R35.1 R36.1 R38.1 R45.3(CW) R46.3(CW) U5.16(VDD)
GND: C10.1 C15.1 C16.1 C17.1 C18.1 D9.1(A) D12.1(A) D13.1(A) D14.1(A) R11.2 R16.2 R25.2 R29.2 R45.1(CCW) R46.1(CCW) U5.8(VSS) U5.10(INHIBIT) U5.15(3-STATE_DISABLE)
Costa: R42.2 ; port Costa
D0: C13.2 D10.2(K) LED18.2 R39.1 U5.1(D0)
D1: C14.2 D11.2(K) LED19.2 R40.1 U5.2(D1)
D2: C15.2 D12.2(K) LED20.2 R41.1 U5.3(D2)
D3: C18.2 D14.2(K) LED22.2 R44.1 U5.4(D3)
D4: R11.1 SW1.1 SW2.2 U5.5(D4)
D5: R16.1 SW1.3 SW2.4 U5.6(D5)
D6: R29.1 SW1.5 SW2.6 U5.7(D6)
D7: R25.1 SW1.7 SW2.8 U5.9(D7)
LSC: R39.2 ; port LSC
LSO: R40.2 ; port LSO
PED.: R43.2 ; port PED.
PHO: R41.2 ; port PHO
RA0: R46.2(Wiper) ; port RA0
RA1: R45.2(Wiper) ; port RA1
RA2: C16.2 D9.2(K) R42.1 ; port RA2
RA3: D#2.1(A) D#3.1(A) D#4.1(A) D#5.1(A) ; port RA3
RA5: U5.14(SEL._OUTPUT) ; port RA5
RA7: C17.2 D13.2(K) LED21.2 R43.1 ; port RA7
RB7: D#6.1(A) D#7.1(A) D#8.1(A) D#9.1(A) ; port RB7
RC5: U5.11(A) ; port RC5
RC6: U5.12(B) ; port RC6
RC7: U5.13(C) ; port RC7
Sd1: D#2.2(K) SW2.1
Sd1#: D#6.2(K) SW1.2
Sd2: D#3.2(K) SW2.3
Sd2#: D#7.2(K) SW1.4
Sd3: D#4.2(K) SW2.5
Sd3#: D#8.2(K) SW1.6
Sd4: D#5.2(K) SW2.7
Sd4#: D#9.2(K) SW1.8
Start: R44.2 ; port Start
Stop: C13.1 C14.1 D10.1(A) D11.1(A) ; port Stop
NetLED18_1: LED18.1 R33.2
NetLED19_1: LED19.1 R34.2
NetLED20_1: LED20.1 R35.2
NetLED21_1: LED21.1 R36.2
NetLED22_1: LED22.1 R38.2

### Notes on the sheet
- Options
- (near R45) Power Slow
- (near R46) Power
- File:
- Title:
- Date:
- Page
- Num:
- Total:
- Drawn By: Huzaifa Ali

### Library data of the parts
C10 = CC0603KRX5R9BB104: as C8 on sheet Controller Sheet; Supplier 1: Digi-Key; Manufacturer Part Number: CC0603KRX5R9BB104; RoHS: Yes; Category: Ceramic Capacitors; Stock 1: 152253; Pricing 1: 1=0.10000, 10=0.05200, 50=0.02820, 100=0.02310, 500=0.01648, 1000=0.01294 (USD); Mount: Surface Mount; Case/Package: 0603; Case Code (Imperial): 0603; Case Code (Metric): 1608; Weight: 7.1E-05oz; Min Operating Temperature: -55°C; Max Operating Temperature: 85°C; Capacitance: 100nF; Packaging: Tape and Reel; Voltage Rating: 50V; Dielectric: X5R; Termination: SMD/SMT; Voltage Rating (DC): 50V; Package Quantity: 4000; Length: 0.063inch; Width: 0.031inch; Thickness: 0.035inch; Lead Free: Lead Free; Halogen Free: Halogen Free; ComponentLink1URL: http://www.mouser.com/ds/2/447/Yageo_UPY-GP_NP0_16V-to-50V_9-358835.pdf?src-supplier=Mouser; ComponentLink1Description: http://www.mouser.com/ds/2/447/Yageo_UPY-GP_NP0_16V-to-50V_9-358835.pdf?src-supplier=Mouser; ComponentLink2URL: https://www.yageo.com/upload/media/product/productsearch/datasheet/mlcc/UPY-GPHC_X5R_4V-to-50V_26.pdf?src-supplier=Digi-Key; ComponentLink2Description: https://www.yageo.com/upload/media/product/productsearch/datasheet/mlcc/UPY-GPHC_X5R_4V-to-50V_26.pdf?src-supplier=Digi-Key; ComponentLink3URL: http://www.yageo.com/exep/pages/download/literatures/ProductSelectionGuide%202014_Final_2.pdf?src-supplier=Digi-Key; ComponentLink3Description: http://www.yageo.com/exep/pages/download/literatures/ProductSelectionGuide%202014_Final_2.pdf?src-supplier=Digi-Key; Supplier Part Number 1: 311-4046-1-ND; LCSC Part Number: C110022
C13-C18 = 08051C224K4T2A: CAP CER 0.22UF 100V X7R 0805; Manufacturer: Kyocera AVX; Tolerance: 10%; Item Type: Capacitor; Supplier 1: Digi-Key; Manufacturer Part Number: 08051C224K4T2A; RoHS: Yes; Category: Ceramic Capacitors; Stock 1: 151; Pricing 1: 1=0.27000, 10=0.18500, 50=0.12320, 100=0.10470, 500=0.07392, 1000=0.06468 (USD); Mount: Surface Mount; Case/Package: 0805; Contact Plating: Tin; Min Operating Temperature: -55°C; Max Operating Temperature: 125°C; Termination: Wraparound; Capacitance: 220nF; Dielectric: X7R; Voltage Rating (DC): 100V; Length: 2.01mm; RoHS Compliant: Yes; ComponentLink1URL: http://datasheets.avx.com/AutoMLCC.pdf?src-supplier=Avnet+Asia; ComponentLink1Description: http://datasheets.avx.com/AutoMLCC.pdf?src-supplier=Avnet+Asia; Supplier Part Number 1: 478-13049-1-ND; LCSC Part Number: C2176107
D9-D14 D#2-D#9 = 1N4148W-7-F: as D8 on sheet Controller Sheet; Supplier 1: Future Electronics; Manufacturer Part Number: 1N4148W-7-F; RoHS: Yes; Category: Rectifier Diodes; Stock 1: 32931000; Pricing 1: 3000=0.01840, 12000=0.01760, 45000=0.01690, 120000=0.01640, 300000=0.01560 (USD); Mounting Technology: Surface Mount; Pins: 2; Weight: 0.000353oz; Contact Plating: Tin,Matte; Min Operating Temperature: -65°C; Max Operating Temperature: 150°C; Packaging: Tape and Reel; Max Repetitive Reverse Voltage (Vrrm): 100V; Peak Non-Repetitive Surge Current: 2A; Voltage: 100V; Max Surge Current: 2A; Package Quantity: 3000; Recovery Time: 4ns; Average Rectified Current: 300mA; Power Rating: 400mW; Current Rating: 150mA; Output Current: 150mA; Max Reverse Voltage (DC): 100V; Series: -; Reverse Recovery Time-Max: 4ns; Length: 2.85mm; Width: 1.7mm; Height: 1.25mm; Radiation Hardening: No; RoHS Compliant: Yes; Reach SVHC Compliant: Yes; Lead Free: Lead Free; ComponentLink1URL: https://datasheet.ciiva.com/1179/1915529-1179304.pdf?src-supplier=Element14; ComponentLink1Description: https://datasheet.ciiva.com/1179/1915529-1179304.pdf?src-supplier=Element14; ComponentLink2URL: https://datasheet.ciiva.com/22695/1915529-22695239.pdf?src-supplier=Element14; ComponentLink2Description: https://datasheet.ciiva.com/22695/1915529-22695239.pdf?src-supplier=Element14; ComponentLink3URL: https://datasheet.ciiva.com/8300/ds30086-8300392.pdf?src-supplier=Avnet; ComponentLink3Description: https://datasheet.ciiva.com/8300/ds30086-8300392.pdf?src-supplier=Avnet; ComponentLink4URL: https://datasheet.ciiva.com/15219/getdatasheetpartid-110030-15219548.pdf?src-supplier=Verical; ComponentLink4Description: https://datasheet.ciiva.com/15219/getdatasheetpartid-110030-15219548.pdf?src-supplier=Verical; ComponentLink5URL: https://datasheet.ciiva.com/8303/ds30086-8303197.pdf?src-supplier=Avnet; ComponentLink5Description: https://datasheet.ciiva.com/8303/ds30086-8303197.pdf?src-supplier=Avnet; ComponentLink6URL: https://datasheet.ciiva.com/911/ds30086-911735.pdf?src-supplier=Digi-Key; ComponentLink6Description: https://datasheet.ciiva.com/911/ds30086-911735.pdf?src-supplier=Digi-Key; ComponentLink7URL: https://datasheet.ciiva.com/911/ds30086-911736.pdf?src-supplier=Digi-Key; ComponentLink7Description: https://datasheet.ciiva.com/911/ds30086-911736.pdf?src-supplier=Digi-Key; ComponentLink8URL: https://datasheet.ciiva.com/911/ds30086-911734.pdf?src-supplier=Digi-Key; ComponentLink8Description: https://datasheet.ciiva.com/911/ds30086-911734.pdf?src-supplier=Digi-Key; ComponentLink9URL: https://datasheet.ciiva.com/4435/ds30086-4435128.pdf?src-supplier=Mouser; ComponentLink9Description: https://datasheet.ciiva.com/4435/ds30086-4435128.pdf?src-supplier=Mouser; Supplier Part Number 1: 7634694; LCSC Part Number: C83528; Item Type: Diode
LED18-LED22 = NCD0603B3: as LED15 on sheet Controller Sheet; Manufacturer Part Number: NCD0603B3; Package: 0603; LCSC Part Number: C158101; Item Type: LED; ComponentLink1Description: LCSC; ComponentLink1URL: https://www.lcsc.com/product-detail/Light-Emitting-Diodes-LED_Foshan-NationStar-Optoelectronics-NCD0603B3_C158101.html
R11 R16 R25 R29 = RC0603JR-07100KL: RES 100K OHM 5% 1/10W 0603; Manufacturer: Yageo; Resistance: 100kR; Temperature Coefficient: 100ppm/°C; Voltage Rating: 50V; Power Rating: 100mW; Item Type: Resistor; Supplier 1: Digi-Key; Manufacturer Part Number: RC0603JR-07100KL; RoHS: Yes; Category: Chip SMD Resistors; Stock 1: 1210037; Pricing 1: 1=0.10000, 10=0.02000, 100=0.00800, 1000=0.00360, 2500=0.00312 (USD); Case/Package: 0603; Number of Pins: 2; Contact Plating: Tin,Matte; Case Code (Imperial): 0603; Case Code (Metric): 1608; Size Code: 0603; Min Operating Temperature: -55°C; Max Operating Temperature: 155°C; Tolerance: 5%; Resistor Type: Thick Film; Packaging: Tape and Reel; Voltage Rating (DC): 50V; Termination: SMD/SMT; Features: Moisture Resistant; Series: RC; Max Power Dissipation: 100mW; Number of Terminations: 2; Resistance Tolerance: 5%; Width: 0.8mm; Radiation Hardening: No; REACH SVHC: No SVHC; Lead Free: Lead Free; RoHS Compliant: Yes; ComponentLink1URL: https://datasheet.ciiva.com/7746/443971-7746424.pdf?src-supplier=Element14; ComponentLink1Description: https://datasheet.ciiva.com/7746/443971-7746424.pdf?src-supplier=Element14; ComponentLink2URL: https://datasheet.ciiva.com/7983/443971-7983686.pdf?src-supplier=Element14; ComponentLink2Description: https://datasheet.ciiva.com/7983/443971-7983686.pdf?src-supplier=Element14; ComponentLink3URL: https://datasheet.ciiva.com/7746/443971-7746423.pdf?src-supplier=Element14; ComponentLink3Description: https://datasheet.ciiva.com/7746/443971-7746423.pdf?src-supplier=Element14; ComponentLink4URL: https://datasheet.ciiva.com/8887/pyu-rc0603-51-rohs-l-4-8887903.pdf?src-supplier=Avnet; ComponentLink4Description: https://datasheet.ciiva.com/8887/pyu-rc0603-51-rohs-l-4-8887903.pdf?src-supplier=Avnet; Supplier Part Number 1: 311-100KGRCT-ND; LCSC Part Number: C100048
R33-R36 R38 = RC0603FR-071K5L: as R10 on sheet Controller Sheet; Supplier 1: Arrow Electronics; Manufacturer Part Number: RC0603FR-071K5L; RoHS: Yes; Category: Chip SMD Resistors; Stock 1: 15000; Pricing 1: 1=0.00160, 5000=0.00160 (USD); Case/Package: 0603; Number of Pins: 2; Case Code (Metric): 1608; Case Code (Imperial): 0603; Size Code: 0603; Min Operating Temperature: -55°C; Max Operating Temperature: 155°C; Tolerance: 1%; Packaging: Tape and Reel; Resistor Type: Thick Film; Voltage Rating: 50V; Package Quantity: 1; Number of Terminations: 2; Termination: SMD/SMT; Max Power Dissipation: 100mW; Features: Moisture Resistant; Series: RC; Resistance Tolerance: 1%; Construction: Rectangular; Length: 0.063inch; Width: 0.031inch; Height: 0.022inch; Depth: 0.8mm; REACH SVHC: No SVHC; Lead Free: Lead Free; Military Standard: Not; RoHS Compliant: Yes; Supplier Part Number 1: RC0603FR-071K5L; LCSC Part Number: C114668
R39-R44 = RC0603FR-07100RL: RES SMD 100 OHM 1% 1/10W 0603; Manufacturer: Yageo; Temperature Coefficient: 100ppm/°C; Voltage Rating (DC): 50V; Power Rating: 100mW; Item Type: Resistor; Supplier 1: Arrow Electronics; Manufacturer Part Number: RC0603FR-07100RL; RoHS: Yes; Category: Chip SMD Resistors; Stock 1: 3800000; Pricing 1: 5000=0.00300, 5000=0.00200, 5000=0.00450, 50000=0.00410, 500000=0.00230, 2500000=0.00140 (USD); Case/Package: 0603; Number of Pins: 2; Case Code (Imperial): 0603; Case Code (Metric): 1608; Size Code: 0603; Min Operating Temperature: -55°C; Max Operating Temperature: 155°C; Resistance: 100R; Tolerance: 1%; Resistor Type: Thick Film; Packaging: Tape and Reel; Voltage Rating: 50V; Termination: SMD/SMT; Features: Moisture Resistant; Series: RC; Max Power Dissipation: 100mW; Number of Terminations: 2; Construction: Rectangular; Resistance Tolerance: 1%; Technology: THICK FILM; Length: 1.6mm; Width: 0.8mm; Height: 0.45mm; Depth: 0.8mm; REACH SVHC: Unknown; Lead Free: Lead Free; RoHS Compliant: Yes; Military Standard: Not; Supplier Part Number 1: RC0603FR-07100RL; LCSC Part Number: C105588
R45 R46 = PT15-L-V-104(100K): ±20% 250mW 100kΩ - Variable Resistors/Potentiometers ROHS; Manufacturer: BOCHEN; Manufacturer Part Number: PT15-L-V-104(100K); Package: Custom; LCSC Part Number: C5205120; Item Type: Potentiometer; ComponentLink1Description: LCSC; ComponentLink1URL: https://www.lcsc.com/product-detail/Variable-Resistors-Potentiometers_BOCHEN-Chengdu-Guosheng-Tech-PT15-L-V-104-100K_C5205120.html
SW1 SW2 = DS-04-R-T: 4Bit SPST 24V Red 25mA 3000次 Plugin DIP Switches ROHS; Manufacturer: kangshen; Manufacturer Part Number: 208-4; Package: Plugin; LCSC Part Number: C5123702; Item Type: DIP Switch; ComponentLink1Description: LCSC; ComponentLink1URL: https://www.lcsc.com/product-detail/DIP-Switches_CTS-Electronic-Components-208-4_C3012341.html
U5 = CD4512BM: Multiplexer 1-Element CMOS 3-ST 8-IN 16-Pin SOIC Tube; Manufacturer: Texas Instruments; Item Type: IC; Supplier: Mouser; Supplier Part Number: 595-CD4512BM; Manufacturer Part Number: CD4512BM; RoHS: Yes; Category: Integrated Circuits (ICs); Stock: 768; Pricing: 1=1.21, 10=1.03, 50=1.03, 100=1.03, 120=0.789, 520=0.718, 1000=0.542, 2520=0.529, 5000=0.512, 10000=0.505, 25000=0.499 (USD); ComponentLink1URL: https://datasheet.ciiva.com/15087/getdatasheetpartid-393294-15087392.pdf?src-supplier=Verical; ComponentLink1Description: https://datasheet.ciiva.com/15087/getdatasheetpartid-393294-15087392.pdf?src-supplier=Verical; ComponentLink2URL: https://datasheet.ciiva.com/1629/cd4512b-1629722.pdf?src-supplier=Newark; ComponentLink2Description: https://datasheet.ciiva.com/1629/cd4512b-1629722.pdf?src-supplier=Newark; ComponentLink3URL: https://datasheet.ciiva.com/6619/cd4512b-6619077.pdf?src-supplier=Digi-Key; ComponentLink3Description: https://datasheet.ciiva.com/6619/cd4512b-6619077.pdf?src-supplier=Digi-Key; ComponentLink4URL: https://datasheet.ciiva.com/14285/cd4512b-mil-14285481.pdf?src-supplier=Avnet; ComponentLink4Description: https://datasheet.ciiva.com/14285/cd4512b-mil-14285481.pdf?src-supplier=Avnet; LCSC Part Number: C1547339

## Sheet Connector Sheet.SchDoc
size A4; SheetNumber: 5; SheetTotal: 5
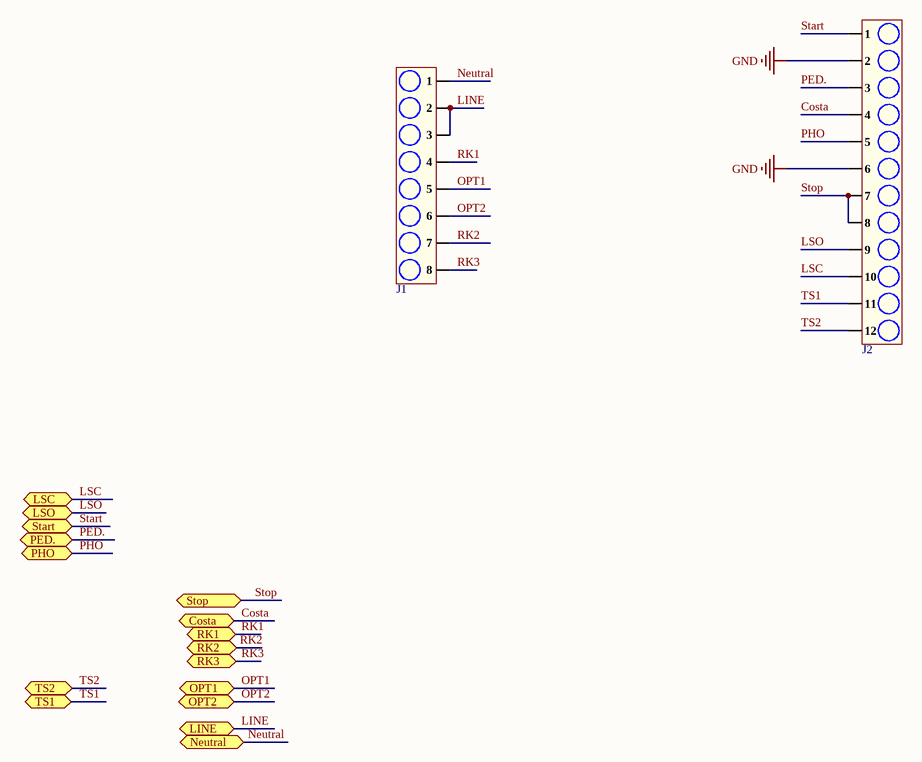
[diagram p4: Connector Sheet.SchDoc]

### Parts
J1  DB2EVC-5.08-8P-GN  [DB2EVC-5.08-8P-GN]  (value not drawn)
J2  DB2EVC-5.08-12P-GN  [DB2EVC-5.08-12P-GN]  (value not drawn)

### Ports
Costa (bidir, see Top Sheet[3B], Controller Sheet[1D], Peripheral Sheet[1D]), LINE (bidir, see Top Sheet[2A], Power Sheet[1D]), LSC (bidir, see Top Sheet[3B], Peripheral Sheet[1D]), LSO (bidir, see Top Sheet[3B], Peripheral Sheet[1D]), Neutral (bidir, see Top Sheet[2B], Power Sheet[1D]), OPT1 (bidir, see Top Sheet[2B], Power Sheet[1D]), OPT2 (bidir, see Top Sheet[2B], Power Sheet[1D]), PED. (bidir, see Top Sheet[3B], Peripheral Sheet[1D]), PHO (bidir, see Top Sheet[3B], Peripheral Sheet[1D]), RK1 (bidir, see Top Sheet[2B], Power Sheet[1D]), RK2 (bidir, see Top Sheet[2B], Power Sheet[1D]), RK3 (bidir, see Top Sheet[2B], Power Sheet[1D]), Start (bidir, see Top Sheet[3A], Peripheral Sheet[1D]), Stop (bidir, see Top Sheet[3B], Peripheral Sheet[1D]), TS1 (bidir, see Top Sheet[2B], Power Sheet[1D]), TS2 (bidir, see Top Sheet[2B], Power Sheet[1D])

### Nets
GND: J2.2 J2.6
Costa: J2.4 ; port Costa
LINE: J1.2 J1.3 ; port LINE
LSC: J2.10 ; port LSC
LSO: J2.9 ; port LSO
Neutral: J1.1 ; port Neutral
OPT1: J1.5 ; port OPT1
OPT2: J1.6 ; port OPT2
PED.: J2.3 ; port PED.
PHO: J2.5 ; port PHO
RK1: J1.4 ; port RK1
RK2: J1.7 ; port RK2
RK3: J1.8 ; port RK3
Start: J2.1 ; port Start
Stop: J2.7 J2.8 ; port Stop
TS1: J2.11 ; port TS1
TS2: J2.12 ; port TS2

### Notes on the sheet
- File:
- Title:
- Date:
- Page
- Num:
- Total:
- Drawn By: Huzaifa Ali

### Library data of the parts
J1 = DB2EVC-5.08-8P-GN: 320V 20A 8 Straight pin -40℃~+105℃ 1 5.08mm 1x8P Green Board Edge/Receptacle-Close Plugin,P=5.08mm Pluggable System Terminal Block ROHS; Manufacturer: DIBO; Manufacturer Part Number: DB2EVC-5.08-8P-GN; Package: Plugin,P=5.08mm; LCSC Part Number: C395784; Item Type: Terminal Block; ComponentLink1Description: LCSC; ComponentLink1URL: https://www.lcsc.com/product-detail/Pluggable-System-Terminal-Block_DIBO-DB2EVC-5-08-8P-GN_C395784.html
J2 = DB2EVC-5.08-12P-GN: 320V 20A 12 Straight pin -40℃~+105℃ 1 5.08mm 1x12P Green Board Edge/Receptacle-Close Plugin,P=5.08mm Pluggable System Terminal Block ROHS; Manufacturer: DIBO; Manufacturer Part Number: DB2EVC-5.08-12P-GN; Package: Plugin,P=5.08mm; LCSC Part Number: C395823; Item Type: Terminal Block; ComponentLink1Description: LCSC; ComponentLink1URL: https://www.lcsc.com/product-detail/Pluggable-System-Terminal-Block_DIBO-DB2EVC-5-08-12P-GN_C395823.html

## Nets that join several sheets
5V: Power Sheet (7 pins), Controller Sheet (17 pins), Peripheral Sheet (9 pins)
GND: Power Sheet (15 pins), Controller Sheet (22 pins), Peripheral Sheet (18 pins), Connector Sheet (J2.2 J2.6)
Costa: Controller Sheet (J8.2), Peripheral Sheet (R42.2), Connector Sheet (J2.4)
DC#: Power Sheet (D4.1 D5.2 D6.2), Controller Sheet (C7.1 R26.2)
LINE: Power Sheet (5 pins), Connector Sheet (J1.2 J1.3)
LSC: Peripheral Sheet (R39.2), Connector Sheet (J2.10)
LSO: Peripheral Sheet (R40.2), Connector Sheet (J2.9)
Neutral: Power Sheet (8 pins), Connector Sheet (J1.1)
OPT1: Power Sheet (Q2.2 R6.1), Connector Sheet (J1.5)
OPT2: Power Sheet (Q1.2 R2.1), Connector Sheet (J1.6)
PED.: Peripheral Sheet (R43.2), Connector Sheet (J2.3)
PHO: Peripheral Sheet (R41.2), Connector Sheet (J2.5)
RA0: Controller Sheet (U3.2), Peripheral Sheet (R46.2)
RA1: Controller Sheet (U3.3), Peripheral Sheet (R45.2)
RA2: Controller Sheet (U3.4), Peripheral Sheet (C16.2 D9.2 R42.1)
RA3: Controller Sheet (J3.2 R12.1 U3.5), Peripheral Sheet (D#2.1 D#3.1 D#4.1 D#5.1)
RA5: Controller Sheet (U3.7), Peripheral Sheet (U5.14)
RA7: Controller Sheet (U3.9), Peripheral Sheet (C17.2 D13.2 LED21.2 R43.1)
RB1: Power Sheet (R18.2), Controller Sheet (U3.22)
RB2: Power Sheet (R14.2), Controller Sheet (U3.23)
RB3: Power Sheet (U1.2), Controller Sheet (U3.24)
RB4: Power Sheet (R22.2), Controller Sheet (J7.3 U3.25)
RB5: Power Sheet (U2.2), Controller Sheet (U3.26)
RB7: Controller Sheet (J#1.4 U3.28), Peripheral Sheet (D#6.1 D#7.1 D#8.1 D#9.1)
RC5: Controller Sheet (J#2.2 R19.1 U3.16 U4.6), Peripheral Sheet (U5.11)
RC6: Controller Sheet (J#2.3 R15.1 U3.17 U4.5), Peripheral Sheet (U5.12)
RC7: Controller Sheet (U3.18), Peripheral Sheet (U5.13)
RK1: Power Sheet (K1.4 K1.5), Connector Sheet (J1.4)
RK2: Power Sheet (K2.4 K2.5), Connector Sheet (J1.7)
RK3: Power Sheet (K3.4 K3.5), Connector Sheet (J1.8)
Start: Peripheral Sheet (R44.2), Connector Sheet (J2.1)
Stop: Peripheral Sheet (C13.1 C14.1 D10.1 D11.1), Connector Sheet (J2.7 J2.8)
TS1: Power Sheet (D5.1 T1.6), Connector Sheet (J2.11)
TS2: Power Sheet (D6.1 T1.10), Connector Sheet (J2.12)